# EAGLE design OG19_PC-3_camera (EAGLE 9.3.2)
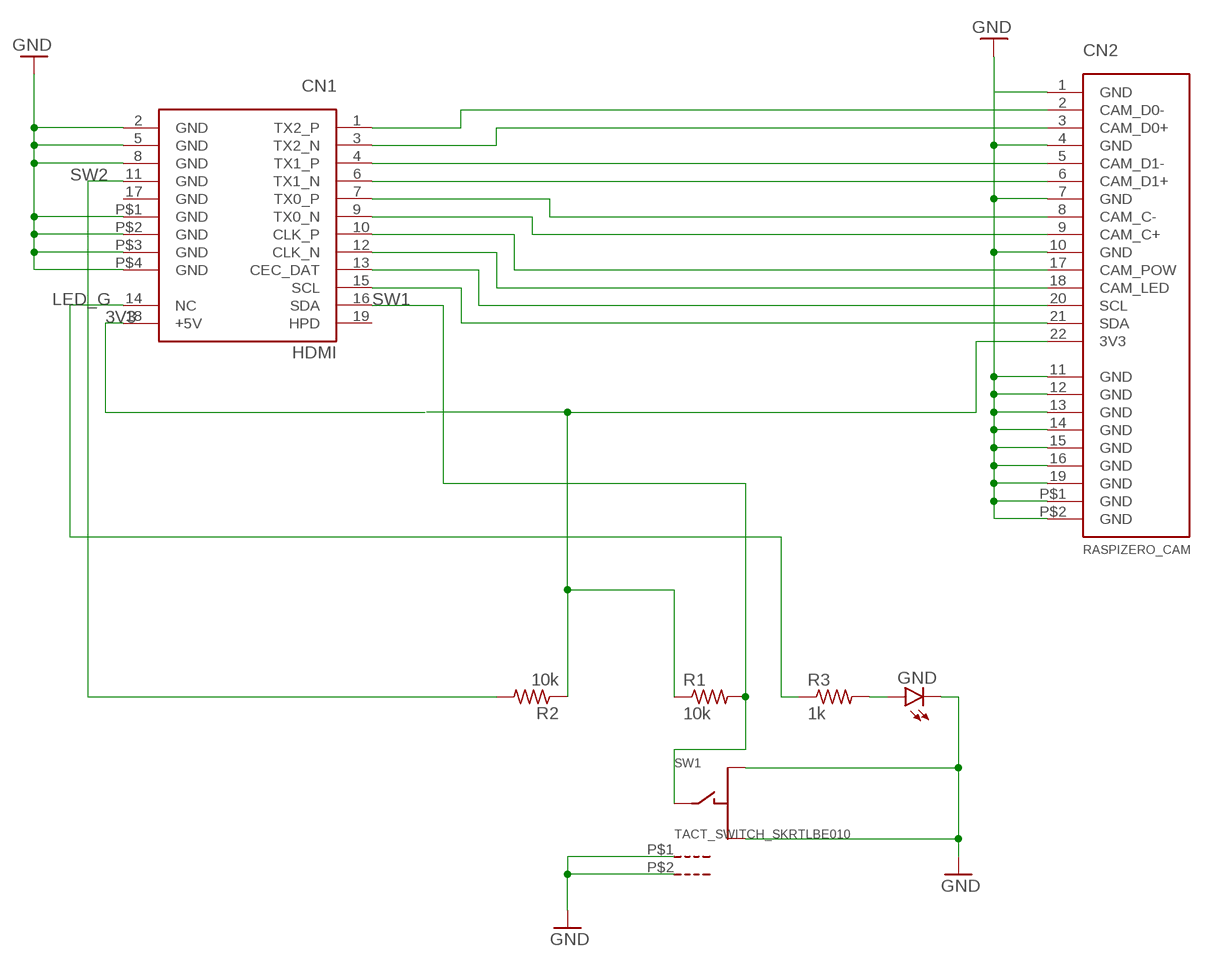
[diagram p0: schematic, sheet 1]

## Parts
CN1  HDMI  [HDMI]
CN2  RASPIZERO_CAM  [FH12-22S-0.5SH]
GND  LEDCHIPLED_0603  [CHIPLED_0603]
R1  10k  R-US_R0603  [R0603]
R2  10k  R-US_R0603  [R0603]
R3  1k  R-US_R0603  [R0603]
SW1  TACT_SWITCH_SKRTLBE010  [SKRTLBE010]

## Nets
3V3: CN1.18(+5V) CN2.22(3V3) R1.1 R2.1
GND: CN1.2(GND) CN1.5(GND) CN1.8(GND) CN1.P$1(GND) CN1.P$2(GND) CN1.P$3(GND) CN1.P$4(GND) CN2.1(GND) CN2.4(GND) CN2.7(GND) CN2.10(GND) CN2.11(GND) CN2.12(GND) CN2.13(GND) CN2.14(GND) CN2.15(GND) CN2.16(GND) CN2.19(GND) CN2.P$1(GND) CN2.P$2(GND) GND.C SW1.P$1(G) SW1.P$2(G) SW1.P$3 SW1.P$5
LED_G: CN1.14(NC) R3.1
N$1: CN1.1(TX2_P) CN2.2(CAM_D0-)
N$2: CN1.10(CLK_P) CN2.17(CAM_POW)
N$3: CN1.3(TX2_N) CN2.3(CAM_D0+)
N$4: CN1.4(TX1_P) CN2.5(CAM_D1-)
N$6: CN1.6(TX1_N) CN2.6(CAM_D1+)
N$8: CN1.13(CEC_DAT) CN2.20(SCL)
N$9: CN1.15(SCL) CN2.21(SDA)
N$10: CN1.12(CLK_N) CN2.18(CAM_LED)
N$14: GND.A R3.2
N$16: CN1.7(TX0_P) CN2.8(CAM_C-)
N$18: CN1.9(TX0_N) CN2.9(CAM_C+)
SW1: CN1.16(SDA) R1.2 SW1.P$4
SW2: CN1.11(GND) R2.2
Unconnected: CN1.17(GND) CN1.19(HPD)

## Library data of the parts
CN1 = raspberrypi_cm:HDMI; LCSC: C427307
CN2 = raspberry_pi_lib:RASPIZERO_CAM; LCSC: C597981
GND = led:LED: LED OSRAM: - CHIPLED LG R971, LG N971, LY N971, LG Q971, LY Q971, LO R971, LY R971 LH N974, LH R974 LS Q976, LO Q976, LY Q976 LO Q996 - Hyper CHIPLED LW Q18S LB Q993, LB Q99A, LB R99A - SideLED LS A670, LO A670, LY A670, LG A670, LP A670 LB A673, LV A673, LT A673, LW A673 LH A674 LY A675 LS A676, LA A676, LO A676, LY A676, LW A676 LS A679, LY A679, LG A679 - Hyper Micro SIDELED® LS Y876, LA Y876, LO Y876, LY Y876 LT Y87S - SmartLED LW L88C, LW L88S LB L89C, LB L89S, LG L890 LS L89K, LO L89K, LY L89K LS L896, LA L896, LO L896, LY L896 - TOPLED LS T670, LO T670, LY T670, LG T670, LP T670 LSG T670, LSP T670, LSY T670, LOP T670, LYG T670 LG T671, LOG T671, LSG T671 LB T673, LV T673, LT T673, LW T673 LH T674 LS T676, LA T676, LO T676, LY T676, LB T676, LH T676, LSB T676, LW T676 LB T67C, LV T67C, LT T67C, LS T67K, LO T67K, LY T67K, LW E67C LS E67B, LA E67B, LO E67B, LY E67B, LB E67C, LV E67C, LT E67C LW T67C LS T679, LY T679, LG T679 LS T770, LO T770, LY T770, LG T770, LP T770 LB T773, LV T773, LT T773, LW T773 LH T774 LS E675, LA E675, LY E675, LS T675 LS T776, LA T776, LO T776, LY T776, LB T776 LHGB T686 LT T68C, LB T68C - Hyper Mini TOPLED® LB M676 - Mini TOPLED Santana® LG M470 LS M47K, LO M47K, LY M47K Source: http://www.osram.convergy.de LUXEON: - LUMILED® LXK2-PW12-R00, LXK2-PW12-S00, LXK2-PW14-U00, LXK2-PW14-V00 LXK2-PM12-R00, LXK2-PM12-S00, LXK2-PM14-U00 LXK2-PE12-Q00, LXK2-PE12-R00, LXK2-PE12-S00, LXK2-PE14-T00, LXK2-PE14-U00 LXK2-PB12-K00, LXK2-PB12-L00, LXK2-PB12-M00, LXK2-PB14-N00, LXK2-PB14-P00, LXK2-PB14-Q00 LXK2-PR12-L00, LXK2-PR12-M00, LXK2-PR14-Q00, LXK2-PR14-R00 LXK2-PD12-Q00, LXK2-PD12-R00, LXK2-PD12-S00 LXK2-PH12-R00, LXK2-PH12-S00 LXK2-PL12-P00, LXK2-PL12-Q00, LXK2-PL12-R00 Source: www.luxeon.com KINGBRIGHT: KA-3528ASYC Source: www.kingbright.com; LCSC: C2286
R1 R2 = resistor:R-US_: RESISTOR, American symbol; LCSC: C25804
R3 = resistor:R-US_: RESISTOR, American symbol; LCSC: C21190
SW1 = raspberry_pi_lib:TACT_SWITCH_SKRTLBE010; LCSC: C127481

## Board
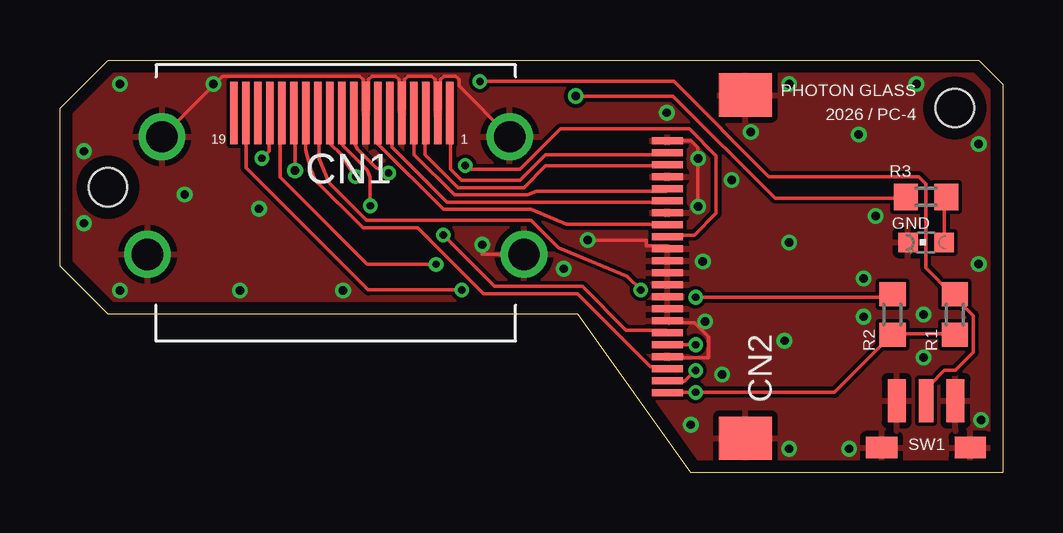
[diagram p1: board, top side]
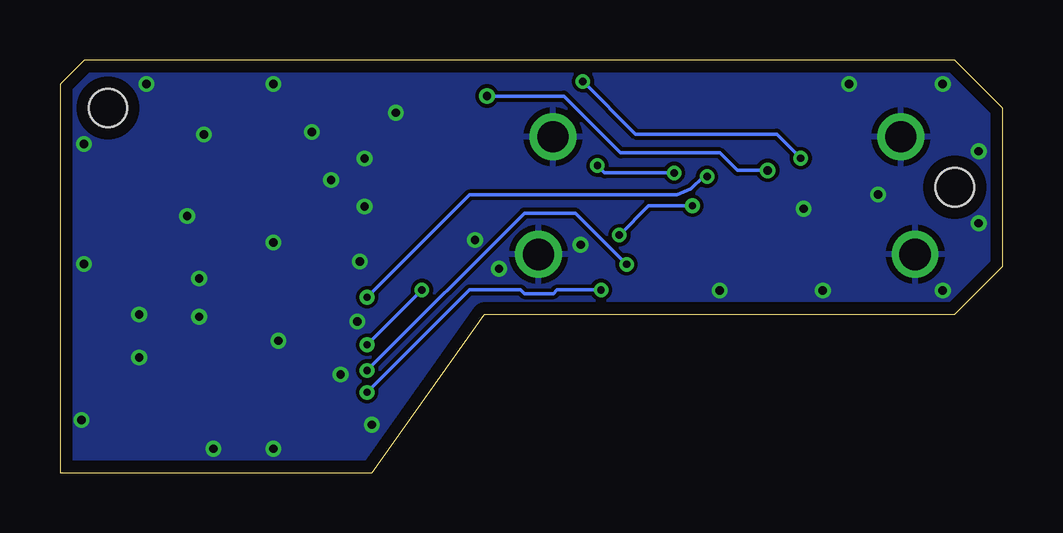
[diagram p2: board, bottom side, seen from below]

Size 39.3 x 17.2 mm. Coordinates in mm from the lower left corner, seen from the top.
Outline: 21.6,6.6 2,6.6 0,8.6 0,15.2 2,17.2 38.3,17.2 39.3,16.2 39.3,0 26.3,0 21.6,6.6
Copper layers (1*16): Top 0.035mm / dielectric 1.6mm / Bottom 0.035mm
Design rules "Elecrow_2-layer_PCB_eagle_rule": minimum track width 6mil, minimum drill 12mil, track to track 6mil, track to pad 6mil, pad to pad 6mil, via to via 8mil, smd to smd 0mil, copper to edge 20mil, drill to drill 10mil, minimum pad ring 6mil, minimum via ring 6mil, stop-mask expansion 0mil, vias tented up to drill 100mil, thermal gap 10mil
Holes 1.6 mm at 37.3,15.2 2,11.9
tRestrict: area 20.4,13.5 to 24.5,14.1; area 19.9,12 to 24.5,12.6; area 20,10.6 to 24.5,11; area 17.9,15 to 27.3,16.7; area 15.5,12.9 to 16,13.6

### Footprints (pad centres in the part's own frame; a part is rotated, then mirrored left to right if it is on the bottom)
HDMI = smd 0.3 x 2.6: 1 4.75,4; 2 4.25,4; 3 3.75,4; 4 3.25,4; 5 2.75,4; 6 2.25,4; 7 1.75,4; 8 1.25,4; 9 0.75,4; 10 0.25,4; 11 -0.25,4; 12 -0.75,4; 13 -1.25,4; 14 -1.75,4; 15 -2.25,4; 16 -2.75,4; 17 -3.25,4; 18 -3.75,4; 19 -4.25,4 | drill 1.3: P$1 7.25,3; P$2 -7.25,3; P$3 -7.85,-1.9; P$4 7.85,-1.9
FH12-22S-0.5SH = smd 0.3 x 1.3: 1 5.25,4.35; 2 4.75,4.35; 3 4.25,4.35; 4 3.75,4.35; 5 3.25,4.35; 6 2.75,4.35; 7 2.25,4.35; 8 1.75,4.35; 9 1.25,4.35; 10 0.75,4.35; 11 0.25,4.35; 12 -0.25,4.35; 13 -0.75,4.35; 14 -1.25,4.35; 15 -1.75,4.35; 16 -2.25,4.35; 17 -2.75,4.35; 18 -3.25,4.35; 19 -3.75,4.35; 20 -4.25,4.35; 21 -4.75,4.35; 22 -5.25,4.35 | smd 1.8 x 2.2: P$1 7.15,1.1; P$2 -7.15,1.1
CHIPLED_0603 = smd 0.8 x 0.8: A 0,-0.75; C 0,0.75
R0603 = smd 1 x 1.1: 1 -0.85,0; 2 0.85,0
SKRTLBE010 = smd 1.3 x 0.9: P$1 -1.85,0.45; P$2 1.85,0.45 | smd 0.75 x 1.8: P$3 -1.225,2.4; P$5 1.225,2.4 | smd 0.6 x 1.8: P$4 0,2.4

### Placement (x,y rotation side)
CN1  11.5,11 0 top
CN2  29.67,8.59 90 top
GND  36.1,9.6 90 top
R1  37.3,6.6 90 top
R2  34.7,6.6 90 top
R3  36.1,11.5 0 top
SW1  36.1,0.6 0 top

### Tracks (layer width: path | path; a pad name or v marks a point on that pad's centre or on a via)
3V3  (via drill 0.3)
  Top 0.152: R1.1 37.17,5.79 34.73,5.79 R2.1 34.58,5.64 32.29,3.35 v26.5,3.35 25.43,3.35 CN2.22 | v16.74,7.62 12.84,7.62 7.75,12.71 7.75,14.94 CN1.18
  Bottom 0.152: v16.74,7.62 18.57,7.62 18.73,7.47 19.94,7.47 20.1,7.62 22.23,7.62 v26.5,3.35
GND  (via drill 0.35)
  Top 0.152: CN2.1 26.3,13.84 26.6,13.54 v26.6,13.1 v26.6,11.1 | CN2.19 25.96,4.84 25.96,4.8 27.03,4.8 27.03,5.67 26.45,6.25 25.41,6.25 CN2.16 | v22,9.7 24.44,9.7 24.44,9.46 25.32,9.46 CN2.10 | CN1.P$4 17.6,9.1 v17.6,9.5 | CN1.P$1 16.63,16.12 16.63,16.39 16.49,16.53 16,16.53 15.87,16.39 15.87,15.12 CN1.2 15.63,15.12 15.63,16.39 15.49,16.53 14.5,16.53 14.37,16.39 14.37,15.12 CN1.5 14.13,15.12 14.13,16.39 13.99,16.53 13,16.53 12.87,16.39 12.87,15.12 CN1.8 12.63,15.12 12.63,16.39 12.49,16.53 6.78,16.53 CN1.P$2
  other vias: 2.5,7.6 1,10.4 1,13.4 2.5,16.2 6.4,16.2 7.5,7.6 11.8,7.6 25.3,15 26.3,2 38.3,13.7 38.3,8.7 38.4,2.2 36,4.8 36,6.6 32.9,1 30.4,1 5.2,11.6 8.3,11 30.4,9.6 28,12.2 30.2,5.5 33.5,6.5 33.5,8.1 34,10.7 33.3,14.1 28.8,14.2 30.4,16.2 35.7,16.2 27.6,4.1 26.9,6.3 26.8,8.8 21,8.5
  pour Top: 0,17.2 39.3,17.2 39.3,0 0,0
  pour Bottom: 0,17.2 0,0 39.3,0 39.3,17.2
LED_G  (via drill 0.35)
  Top 0.152: v9.8,12.6 9.8,15 CN1.14 | v21.5,15.7 25.56,15.7 29.82,11.44 35.21,11.44 35.25,11.48 R3.1
  Bottom 0.152: v9.8,12.6 11.06,12.6 11.79,13.34 15.93,13.34 18.3,15.7 v21.5,15.7
N$1
  Top 0.152: CN2.2 25.28,13.26 20.25,13.26 19.18,12.19 16.74,12.19 16.29,12.65 16.29,14.94 CN1.1
N$2  (via drill 0.3)
  Top 0.152: v15.98,9.91 18.12,7.77 21.77,7.77 23.6,5.94 25.28,5.94 CN2.17 | v12.93,11.12 12.93,12.32 12.81,12.62 11.78,13.65 11.77,13.68 11.77,14.99 CN1.10
  Bottom 0.152: v15.98,9.91 14.76,11.12 v12.93,11.12
N$3
  Top 0.152: CN2.3 25.28,12.8 20.25,12.8 19.34,11.89 16.59,11.89 15.22,13.26 15.22,14.94 CN1.3
N$4
  Top 0.152: CN2.5 25.28,11.73 19.86,11.73 19.49,11.58 16.44,11.58 14.76,13.26 14.76,14.94 CN1.4
N$6
  Top 0.152: CN2.6 25.28,11.28 16.13,11.28 13.85,13.56 13.85,14.94 CN1.6
N$8
  Top 0.152: CN2.20 25.28,4.42 24.62,4.42 21.57,7.47 17.66,7.47 14.92,10.21 12.63,10.21 10.64,12.2 10.44,12.68 10.25,13.46 CN1.13
N$9  (via drill 0.3)
  Top 0.152: v26.5,4.27 26.04,3.81 25.43,3.81 CN2.21 | v15.68,8.69 12.8,8.69 9.18,12.31 9.18,14.93 CN1.15
  Bottom 0.152: v26.5,4.27 19.94,10.82 17.81,10.82 v15.68,8.69
N$10  (via drill 0.3)
  Top 0.152: v26.5,5.33 25.43,5.33 CN2.18 | v24.21,7.62 23.64,8.19 20.78,9.38 19.64,10.52 12.78,10.52 11.21,12.08 10.8,13.08 10.8,14.94 CN1.12
  Bottom 0.152: v24.21,7.62 v26.5,5.33
N$14
  Top 0.152: GND.A 36.86,9.6 36.86,11.43 R3.2
N$16
  Top 0.152: CN2.8 25.28,10.36 21.11,10.36 19.64,10.97 15.98,10.97 13.24,13.72 13.24,14.94 CN1.7
N$18  (via drill 0.3)
  Top 0.152: v16.9,12.8 17.05,12.65 19.18,12.65 20.86,14.33 26.24,14.33 27.35,13.22 27.35,10.81 26.44,9.91 25.43,9.91 CN2.9 | v13.7,12.5 13.18,12.71 12.38,13.51 12.22,13.88 12.22,14.97 CN1.9
  Bottom 0.152: v16.9,12.8 16.59,12.5 v13.7,12.5
SW1  (via drill 0.3)
  Top 0.152: SW1.P$4 36.25,3.05 36.25,3.66 36.86,4.27 37.32,4.27 38.08,5.03 38.08,6.55 37.32,7.32 R1.2 37.17,7.47 36.1,8.53 36.1,12.04 35.79,12.34 29.55,12.34 25.58,16.31 v17.51,16.31 | CN1.16 8.72,14.97 8.72,13.41 v8.42,13.11
  Bottom 0.152: v8.42,13.11 9.42,14.11 15.31,14.11 v17.51,16.31
SW2  (via drill 0.3)
  Top 0.152: v26.5,7.32 34.58,7.32 R2.2 | v12.32,12.34 11.71,13.26 11.26,13.72 11.26,14.94 CN1.11
  Bottom 0.152: v26.5,7.32 22.23,11.58 13.58,11.58 13,11.83 12.48,12.34 v12.32,12.34

### Text on the board
tPlace: 19 | 1
tNames: PHOTON GLASS | 2026 / PC-4